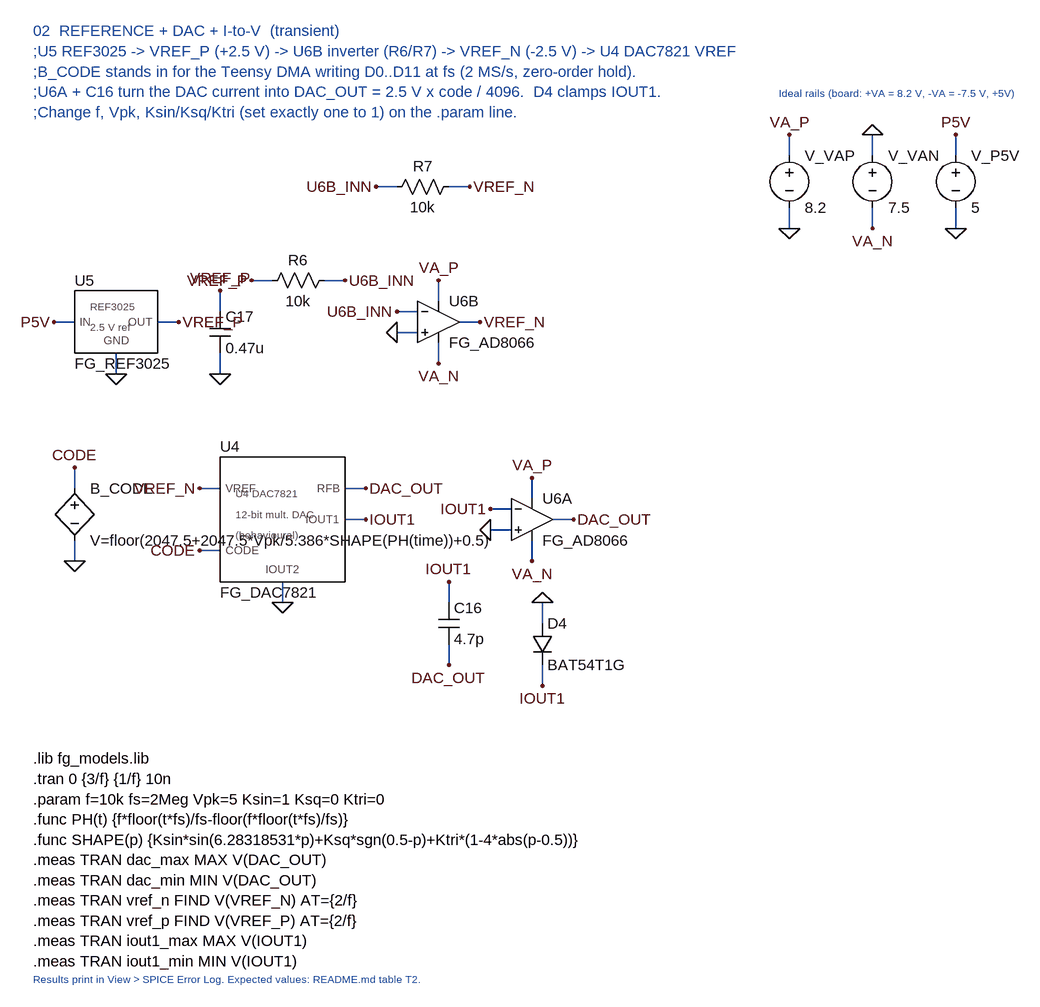
[diagram p0: schematic 02_dac_and_reference.asc]
02_dac_and_reference.asc, the LTspice schematic file:
Version 4
SHEET 1 2400 1600
WIRE 1100 -240 1100 -208
WIRE 1100 -96 1100 -128
WIRE 1228 -240 1228 -208
WIRE 1228 -96 1228 -128
WIRE 1356 -240 1356 -208
WIRE 1356 -96 1356 -128
WIRE -32 48 0 48
WIRE 64 128 64 96
WIRE 160 48 128 48
WIRE 224 0 224 32
WIRE 224 128 224 96
WIRE 416 -16 384 -16
WIRE 272 -16 304 -16
WIRE 496 64 528 64
WIRE 496 32 528 32
WIRE 560 -16 560 16
WIRE 560 112 560 80
WIRE 624 48 592 48
WIRE 608 -160 576 -160
WIRE 464 -160 496 -160
WIRE 0 272 0 304
WIRE 0 416 0 384
WIRE 192 304 224 304
WIRE 448 352 416 352
WIRE 320 480 320 448
WIRE 448 304 416 304
WIRE 192 400 224 400
WIRE 640 368 672 368
WIRE 640 336 672 336
WIRE 704 288 704 320
WIRE 704 416 704 384
WIRE 768 352 736 352
WIRE 576 448 576 480
WIRE 576 576 576 544
WIRE 720 480 720 512
WIRE 720 608 720 576
FLAG 1100 -240 VA_P
FLAG 1100 -96 0
FLAG 1228 -240 0
FLAG 1228 -96 VA_N
FLAG 1356 -240 P5V
FLAG 1356 -96 0
FLAG -32 48 P5V
FLAG 64 128 0
FLAG 160 48 VREF_P
FLAG 224 0 VREF_P
FLAG 224 128 0
FLAG 416 -16 U6B_INN
FLAG 272 -16 VREF_P
FLAG 496 64 0
FLAG 496 32 U6B_INN
FLAG 560 -16 VA_P
FLAG 560 112 VA_N
FLAG 624 48 VREF_N
FLAG 608 -160 VREF_N
FLAG 464 -160 U6B_INN
FLAG 0 272 CODE
FLAG 0 416 0
FLAG 192 304 VREF_N
FLAG 448 352 IOUT1
FLAG 320 480 0
FLAG 448 304 DAC_OUT
FLAG 192 400 CODE
FLAG 640 368 0
FLAG 640 336 IOUT1
FLAG 704 288 VA_P
FLAG 704 416 VA_N
FLAG 768 352 DAC_OUT
FLAG 576 448 IOUT1
FLAG 576 576 DAC_OUT
FLAG 720 480 0
FLAG 720 608 IOUT1
TEXT -64 -400 Left 2 ;02  REFERENCE + DAC + I-to-V  (transient)\n;U5 REF3025 -> VREF_P (+2.5 V) -> U6B inverter (R6/R7) -> VREF_N (-2.5 V) -> U4 DAC7821 VREF\n;B_CODE stands in for the Teensy DMA writing D0..D11 at fs (2 MS/s, zero-order hold).\n;U6A + C16 turn the DAC current into DAC_OUT = 2.5 V x code / 4096.  D4 clamps IOUT1.\n;Change f, Vpk, Ksin/Ksq/Ktri (set exactly one to 1) on the .param line.
SYMBOL voltage 1100 -224 R0
SYMATTR InstName V_VAP
SYMATTR Value 8.2
SYMBOL voltage 1228 -224 R0
SYMATTR InstName V_VAN
SYMATTR Value 7.5
SYMBOL voltage 1356 -224 R0
SYMATTR InstName V_P5V
SYMATTR Value 5
TEXT 1084 -304 Left 1 ;Ideal rails (board: +VA = 8.2 V, -VA = -7.5 V, +5V)
SYMBOL FG_REF3025 0 0 R0
SYMATTR InstName U5
SYMATTR Value FG_REF3025
SYMBOL cap 208 32 R0
SYMATTR InstName C17
SYMATTR Value 0.47u
SYMBOL res 400 -32 R90
WINDOW 0 0 56 VBottom 2
WINDOW 3 32 56 VTop 2
SYMATTR InstName R6
SYMATTR Value 10k
SYMBOL OpAmps\\opamp2 560 -16 R0
SYMATTR InstName U6B
SYMATTR Value FG_AD8066
SYMBOL res 592 -176 R90
WINDOW 0 0 56 VBottom 2
WINDOW 3 32 56 VTop 2
SYMATTR InstName R7
SYMATTR Value 10k
SYMBOL bv 0 288 R0
SYMATTR InstName B_CODE
SYMATTR Value V=floor(2047.5+2047.5*Vpk/5.386*SHAPE(PH(time))+0.5)
SYMBOL FG_DAC7821 224 256 R0
SYMATTR InstName U4
SYMATTR Value FG_DAC7821
SYMBOL OpAmps\\opamp2 704 288 R0
SYMATTR InstName U6A
SYMATTR Value FG_AD8066
SYMBOL cap 560 480 R0
SYMATTR InstName C16
SYMATTR Value 4.7p
SYMBOL diode 704 512 R0
SYMATTR InstName D4
SYMATTR Value BAT54T1G
TEXT -64 720 Left 2 !.lib fg_models.lib\n.tran 0 {3/f} {1/f} 10n\n.param f=10k fs=2Meg Vpk=5 Ksin=1 Ksq=0 Ktri=0\n.func PH(t) {f*floor(t*fs)/fs-floor(f*floor(t*fs)/fs)}\n.func SHAPE(p) {Ksin*sin(6.28318531*p)+Ksq*sgn(0.5-p)+Ktri*(1-4*abs(p-0.5))}\n.meas TRAN dac_max MAX V(DAC_OUT)\n.meas TRAN dac_min MIN V(DAC_OUT)\n.meas TRAN vref_n FIND V(VREF_N) AT={2/f}\n.meas TRAN vref_p FIND V(VREF_P) AT={2/f}\n.meas TRAN iout1_max MAX V(IOUT1)\n.meas TRAN iout1_min MIN V(IOUT1)
TEXT -64 1060 Left 1 ;Results print in View > SPICE Error Log. Expected values: README.md table T2.

The netlist it stands for:
* 02_dac_and_reference.asc
V_VAP VA_P 0 8.2
V_VAN 0 VA_N 7.5
V_P5V P5V 0 5
XU5 P5V 0 VREF_P FG_REF3025 FG_REF3025  ; pins IN GND OUT
C17 VREF_P 0 0.47u
R6 U6B_INN VREF_P 10k
XU6B 0 U6B_INN VA_P VA_N VREF_N FG_AD8066  ; pins In+ In- V+ V- OUT
R7 VREF_N U6B_INN 10k
B_CODE CODE 0 V=floor(2047.5+2047.5*Vpk/5.386*SHAPE(PH(time))+0.5)
XU4 VREF_N IOUT1 0 DAC_OUT CODE FG_DAC7821 FG_DAC7821  ; pins VREF IOUT1 IOUT2 RFB CODE
XU6A 0 IOUT1 VA_P VA_N DAC_OUT FG_AD8066  ; pins In+ In- V+ V- OUT
C16 IOUT1 DAC_OUT 4.7p
D4 0 IOUT1 BAT54T1G
.model D D
.lib standard.dio
* 02  REFERENCE + DAC + I-to-V  (transient)
* ;U5 REF3025 -> VREF_P (+2.5 V) -> U6B inverter (R6/R7) -> VREF_N (-2.5 V) -> U4 DAC7821 VREF
* ;B_CODE stands in for the Teensy DMA writing D0..D11 at fs (2 MS/s, zero-order hold).
* ;U6A + C16 turn the DAC current into DAC_OUT = 2.5 V x code / 4096.  D4 clamps IOUT1.
* ;Change f, Vpk, Ksin/Ksq/Ktri (set exactly one to 1) on the .param line.
* Ideal rails (board: +VA = 8.2 V, -VA = -7.5 V, +5V)
.lib fg_models.lib
.tran 0 {3/f} {1/f} 10n
.param f=10k fs=2Meg Vpk=5 Ksin=1 Ksq=0 Ktri=0
.func PH(t) {f*floor(t*fs)/fs-floor(f*floor(t*fs)/fs)}
.func SHAPE(p) {Ksin*sin(6.28318531*p)+Ksq*sgn(0.5-p)+Ktri*(1-4*abs(p-0.5))}
.meas TRAN dac_max MAX V(DAC_OUT)
.meas TRAN dac_min MIN V(DAC_OUT)
.meas TRAN vref_n FIND V(VREF_N) AT={2/f}
.meas TRAN vref_p FIND V(VREF_P) AT={2/f}
.meas TRAN iout1_max MAX V(IOUT1)
.meas TRAN iout1_min MIN V(IOUT1)
* Results print in View > SPICE Error Log. Expected values: README.md table T2.
.backanno
.end